# Altium schematic sheet Sheet1.SchDoc
size A3; SheetNumber: 1; SheetTotal: 1
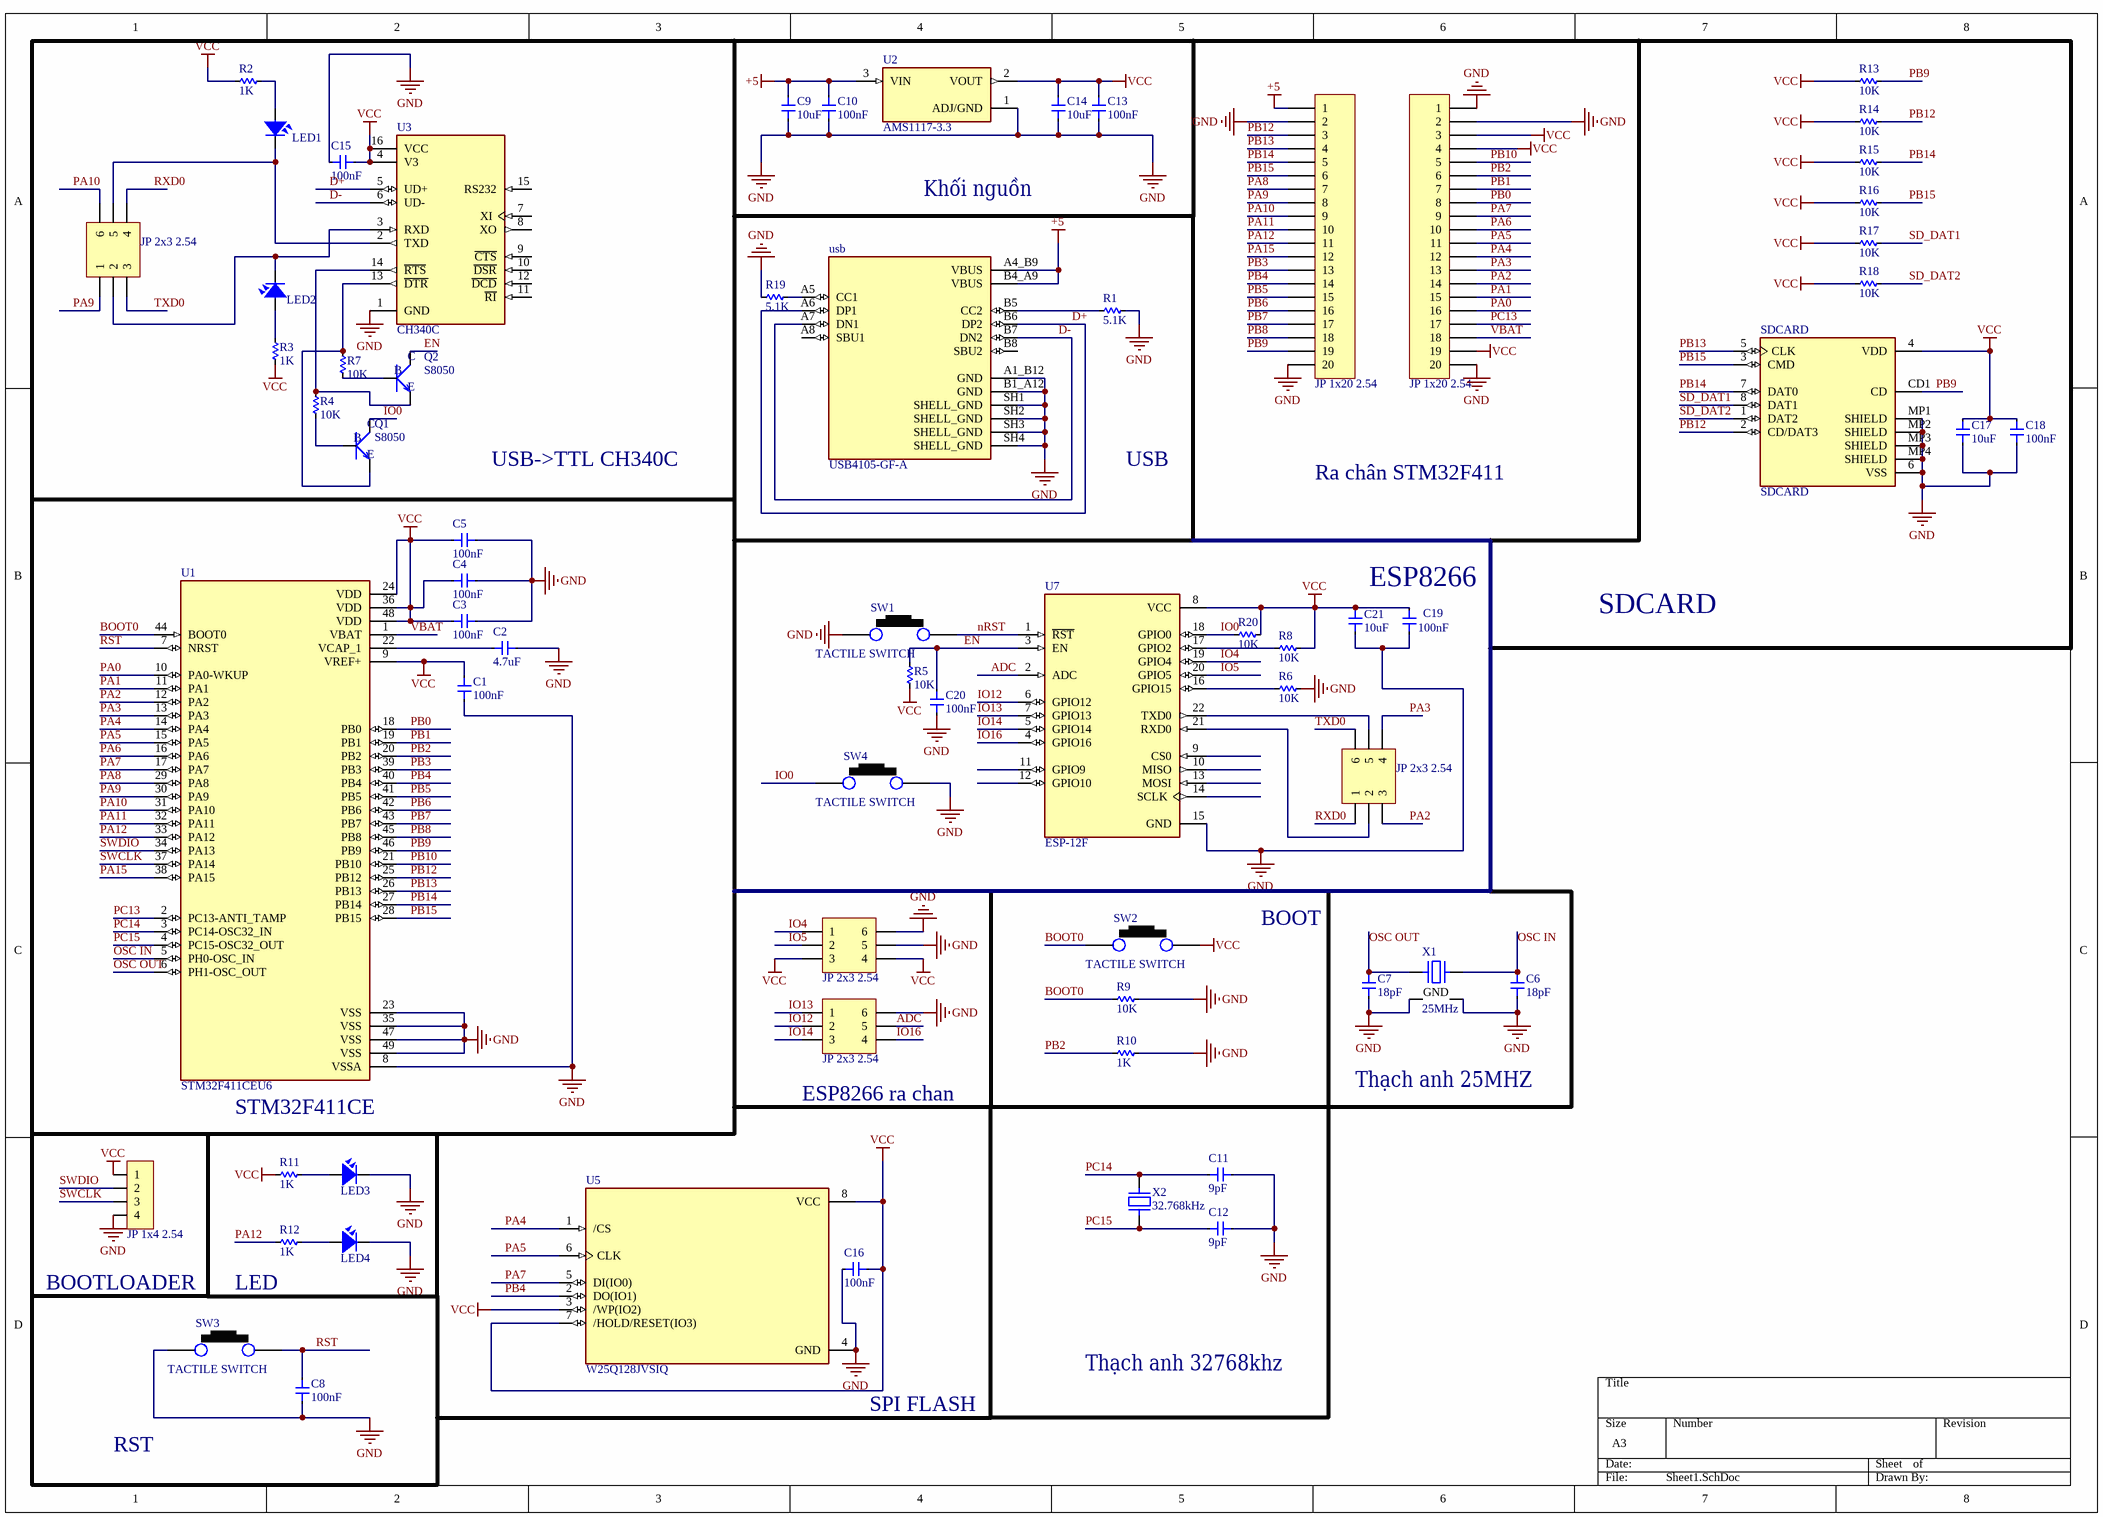
[diagram p0: Sheet1.SchDoc]

## Parts
(Parts that share a designator on the sheet are numbered #1, #2 ... from top to bottom, then left to right.)
?#1  JP 1x20 2.54  [JP 1x20 CT]
?#2  JP 1x20 2.54  [JP 1x20 CT]
?#3  JP 2x3 2.54  [JP 2x3 CT]
?#4  JP 2x3 2.54  [JP 2x3 CT]
?#5  JP 2x3 2.54  [JP 2x3 CT]
?#6  JP 2x3 2.54  [JP 2x3 CT]
C1  100nF  [Cap 0603]
C2  4.7uF  [Cap 0603]
C3  100nF  [Cap 0603]
C4  100nF  [Cap 0603]
C5  100nF  [Cap 0603]
C6  18pF  [Cap 0603]
C7  18pF  [Cap 0603]
C8  100nF  [Cap 0603]
C9  10uF  [Cap 0603]
C10  100nF  [Cap 0603]
C11  9pF  [Cap 0603]
C12  9pF  [Cap 0603]
C13  100nF  [Cap 0603]
C14  10uF  [Cap 0603]
C15  100nF  [Cap 0603]
C16  100nF  [Cap 0603]
C17  10uF  [Cap 0603]
C18  100nF  [Cap 0603]
C19  100nF  [Cap 0603]
C20  100nF  [Cap 0603]
C21  10uF  [Cap 0603]
JP5  JP 1x4 2.54  [JP 1x4 DC]
LED1  LED  [LED-1206-Blue]  (value not drawn)
LED2  LED  [LED-1206-Blue]  (value not drawn)
LED3  LED  [LED-1206-Green]  (value not drawn)
LED4  LED  [LED-1206-Green]  (value not drawn)
Q1  S8050  [SOT-23]
Q2  S8050  [SOT-23]
R1  5.1K  [tro smd 0603]
R2  1K  [tro smd 0603]
R3  1K  [tro smd 0603]
R4  10K  [tro smd 0603]
R5  10K  [tro smd 0603]
R6  10K  [tro smd 0603]
R7  10K  [tro smd 0603]
R8  10K  [tro smd 0603]
R9  10K  [tro smd 0603]
R10  1K  [tro smd 0603]
R11  1K  [tro smd 0603]
R12  1K  [tro smd 0603]
R13  10K  [tro smd 0603]
R14  10K  [tro smd 0603]
R15  10K  [tro smd 0603]
R16  10K  [tro smd 0603]
R17  10K  [tro smd 0603]
R18  10K  [tro smd 0603]
R19  5.1K  [RES 0603]
R20  10K  [tro smd 0603]
SDCARD  SDCARD  [SDCARD]
SW1  TACTILE SWITCH  [SW_342_SMD]
SW2  TACTILE SWITCH  [SW_342_SMD]
SW3  TACTILE SWITCH  [SW_342_SMD]
SW4  TACTILE SWITCH  [SW_342_SMD]
U1  STM32F411CEU6  [QFN50P700X700X60-49N]
U2  AMS1117-3.3  [SOT229P700X180-4N]
U3  CH340C  [SOIC127P600X180-16N]
U5  W25Q128JVSIQ  [SOIC127P790X216-8N]
U7  ESP-12F  [XCVR_ESP-12F]
usb  USB4105-GF-A  [GCT_USB4105-GF-A]
X1  25MHz  [EPSON TSX-3225]
X2  32.768kHz  [ABRACON ABS07]

## Nets
+5: ?#1.1 C9.1 C10.1 U2.3(VIN) usb.A4_B9(VBUS) usb.B4_A9(VBUS)
GND: ?#1.2 ?#1.20 ?#2.1 ?#2.2 ?#2.20 ?#5.5 ?#5.6 ?#6.6 C1.1 C2.1 C3.2 C4.2 C5.2 C6.1 C7.1 C8.1 C9.2 C10.2 C11.1 C12.1 C13.2 C14.2 C15.2 C16.1 C17.1 C18.1 C19.1 C20.2 C21.2 JP5.4 LED3.2 LED4.2 R1.1 R6.1 R9.2 R10.2 R19.2 SDCARD.6(VSS) SDCARD.MP1(SHIELD) SDCARD.MP2(SHIELD) SDCARD.MP3(SHIELD) SDCARD.MP4(SHIELD) SW1.1 SW3.1 SW4.2 U1.8(VSSA) U1.23(VSS) U1.35(VSS) U1.47(VSS) U1.49(VSS) U2.1(ADJ/GND) U3.1(GND) U5.4(GND) U7.15(GND) usb.A1_B12(GND) usb.B1_A12(GND) usb.SH1(SHELL_GND) usb.SH2(SHELL_GND) usb.SH3(SHELL_GND) usb.SH4(SHELL_GND) X1.2(GND) X1.4(GND)
VCC: ?#2.3 ?#2.4 ?#2.19 ?#5.3 ?#5.4 C1.2 C3.1 C4.1 C5.1 C13.1 C14.1 C15.1 C16.2 C17.2 C18.2 C19.2 C21.1 JP5.1 R2.2 R3.2 R5.2 R8.1 R11.1 R13.2 R14.2 R15.2 R16.2 R17.2 R18.2 R20.1 SDCARD.4(VDD) SW2.2 U1.9(VREF+) U1.24(VDD) U1.36(VDD) U1.48(VDD) U2.2(VOUT) U3.4(V3) U3.16(VCC) U5.3(/WP(IO2)) U5.7(/HOLD/RESET(IO3)) U5.8(VCC) U7.8(VCC)
ADC: ?#6.5 U7.2(ADC)
BOOT0: R9.1 SW2.1 U1.44(BOOT0)
D+: U3.5(UD+) usb.A6(DP1) usb.B6(DP2)
D-: U3.6(UD-) usb.A7(DN1) usb.B7(DN2)
EN: C20.1 Q2.3(C) R5.1 U7.3(EN)
IO0: Q1.3(C) R20.2 SW4.1 U7.18(GPIO0)
IO4: ?#5.1 U7.19(GPIO4)
IO5: ?#5.2 U7.20(GPIO5)
IO12: ?#6.2 U7.6(GPIO12)
IO13: ?#6.1 U7.7(GPIO13)
IO14: ?#6.3 U7.5(GPIO14)
IO16: ?#6.4 U7.4(GPIO16)
nRST: SW1.2 U7.1(~{RST})
OSC IN: C6.2 U1.5(PH0-OSC_IN) X1.3
OSC OUT: C7.2 U1.6(PH1-OSC_OUT) X1.1
PA0: ?#2.16 U1.10(PA0-WKUP)
PA1: ?#2.15 U1.11(PA1)
PA2: ?#2.14 ?#4.3 U1.12(PA2)
PA3: ?#2.13 ?#4.4 U1.13(PA3)
PA4: ?#2.12 U1.14(PA4) U5.1(/CS)
PA5: ?#2.11 U1.15(PA5) U5.6(CLK)
PA6: ?#2.10 U1.16(PA6)
PA7: ?#2.9 U1.17(PA7) U5.5(DI(IO0))
PA8: ?#1.7 U1.29(PA8)
PA9: ?#1.8 ?#3.1 U1.30(PA9)
PA10: ?#1.9 ?#3.6 U1.31(PA10)
PA11: ?#1.10 U1.32(PA11)
PA12: ?#1.11 R12.1 U1.33(PA12)
PA15: ?#1.12 U1.38(PA15)
PB0: ?#2.8 U1.18(PB0)
PB1: ?#2.7 U1.19(PB1)
PB2: ?#2.6 R10.1 U1.20(PB2)
PB3: ?#1.13 U1.39(PB3)
PB4: ?#1.14 U1.40(PB4) U5.2(DO(IO1))
PB5: ?#1.15 U1.41(PB5)
PB6: ?#1.16 U1.42(PB6)
PB7: ?#1.17 U1.43(PB7)
PB8: ?#1.18 U1.45(PB8)
PB9: ?#1.19 R13.1 SDCARD.CD1(CD) U1.46(PB9)
PB10: ?#2.5 U1.21(PB10)
PB12: ?#1.3 R14.1 SDCARD.2(CD/DAT3) U1.25(PB12)
PB13: ?#1.4 SDCARD.5(CLK) U1.26(PB13)
PB14: ?#1.5 R15.1 SDCARD.7(DAT0) U1.27(PB14)
PB15: ?#1.6 R16.1 SDCARD.3(CMD) U1.28(PB15)
PC13: ?#2.17 U1.2(PC13-ANTI_TAMP)
PC14: C11.2 U1.3(PC14-OSC32_IN) X2.2
PC15: C12.2 U1.4(PC15-OSC32_OUT) X2.1
RST: C8.2 SW3.2 U1.7(NRST)
RXD0: ?#3.4 ?#4.1
SD_DAT1: R17.1 SDCARD.8(DAT1)
SD_DAT2: R18.1 SDCARD.1(DAT2)
SWCLK: JP5.3 U1.37(PA14)
SWDIO: JP5.2 U1.34(PA13)
TXD0: ?#3.3 ?#4.6
VBAT: ?#2.18 U1.1(VBAT)
Net?#3_2: ?#3.2 LED2.2 U3.3(RXD)
Net?#3_5: ?#3.5 LED1.2 U3.2(TXD)
Net?#4_2: ?#4.2 U7.21(RXD0)
Net?#4_5: ?#4.5 U7.22(TXD0)
NetC2_2: C2.2 U1.22(VCAP_1)
NetLED1_1: LED1.1 R2.1
NetLED2_1: LED2.1 R3.1
NetLED3_1: LED3.1 R11.2
NetLED4_1: LED4.1 R12.2
NetQ1_1: Q1.1(B) R4.2
NetQ1_2: Q1.2(E) R7.1 U3.13(~{DTR})
NetQ2_1: Q2.1(B) R7.2
NetQ2_2: Q2.2(E) R4.1 U3.14(~{RTS})
NetR1_2: R1.2 usb.B5(CC2)
NetR6_2: R6.2 U7.16(GPIO15)
NetR8_2: R8.2 U7.17(GPIO2)
NetR19_1: R19.1 usb.A5(CC1)

Not connected (* = marked no-connect by the designer): U3 7(XI) 8(XO) 9(~{CTS}) 10(~{DSR}) 11(~{RI}) 12(~{DCD}) 15(RS232); U7 9(CS0) 10(MISO) 11(GPIO9) 12(GPIO10) 13(MOSI) 14(SCLK); usb A8(SBU1) B8(SBU2)

## Notes on the sheet
- Khối nguồn
- USB->TTL CH340C
- USB
- Ra chân STM32F411
- ESP8266
- SDCARD
- BOOT
- (near U1) STM32F411CE
- ESP8266 ra chan
- Thạch anh 25MHZ
- BOOTLOADER
- (near R12) LED
- Thạch anh 32768khz
- RST
- SPI FLASH

## Library data of the parts
?#1 ?#2 = JP 1x20 2.54 Cai Thang: Cắm; Ten_Linh_Kien: Jump Đơn Cái 2.54MM 1x20P Thẳng; Don_Vi: Con; Ma_Hang: MH004006; Ghi_Chu: *; Kieu_Chan: *; Chung_Loai: Cắm
?#3-?#6 = JP 2x3 2.54 Cai Thang: Cắm; Ten_Linh_Kien: Jump Đôi Cái 2.54MM 2x20P Thẳng; Don_Vi: Con; Ma_Hang: MH008647; Ghi_Chu: *; Kieu_Chan: *; Chung_Loai: Cắm
C1-C14 C16-C21 = Cap 1206: Capacitor SMD 1206
C15 = Cap 0805: Capacitor SMD 0805
JP5 = JP 1x4 2.54 Duc Cong: Cắm; Ten_Linh_Kien: Jump Đơn Đực 2.54MM 1x40P Cong Đứng; Don_Vi: Con; Ma_Hang: MH000904; Ghi_Chu: *; Kieu_Chan: *; Chung_Loai: Cắm
LED1-LED4 = LED SMD: Value: LED 3 - 5 ly 2 Colour
Q1 Q2 = SMD-TRANSISTORS-NPN-25V-500MW(SOT-23): Bipolar (BJT) Transistor NPN 25 V 500 mA 150MHz 300 mW Surface Mount SOT-23; MF: UMW; Purchase-URL: https://pricing.snapeda.com/search/part/S8050/?ref=eda; Check_prices: https://www.snapeda.com/parts/S8050/Umwelt+Sensor+Teknik/view-part/?ref=eda; SnapEDA_Link: https://www.snapeda.com/parts/S8050/Umwelt+Sensor+Teknik/view-part/?ref=snap; Price: None; Availability: In Stock; Package: None; MP: S8050; Value: *
R1-R20 = Res-SMD: Resistor; Manufacturer: Generic Components; Class: Passive; Published: 08/06/2000; Publisher: Altium Hobart Technology Centre
SW1-SW4 = SW1_RS-282G05A3-SMRT-SMD: Tactile Switch SPST-NO Top Actuated Surface Mount; Manufacturer: ITT C&K; Alternate Part Number-1: NA; Manufacturer Part Number: RS-282G05A3-SMRT; Case/Package: SMD; Supplier-1: SP ROAD; Supplier Part Number-1: RS-282G05A3-SMRT
U1 = STM32F411CEU6: High-performance access line, ARM Cortex-M4 core with DSP and FPU, 512 Kbytes Flash, 100 MHz CPU, ART Accelerator; Package: None; Availability: Unavailable; Value: *; MP: STM32F411CEU6; Price: None
U2 = AMS1117-3.3: Linear Voltage Regulator IC Positive Fixed 1 Output 1A SOT-223-3L; MF: UMW; SnapEDA_Link: https://www.snapeda.com/parts/AMS1117-3.3/UMW/view-part/?ref=snap; Package: SOT-223-3L UMW; Value: *; MP: AMS1117-3.3; Check_prices: https://www.snapeda.com/parts/AMS1117-3.3/UMW/view-part/?ref=eda
U3 = CH340G: USB Interface Integrated Circuit; Value: *; MP: Ch340C
U5 = W25Q128JVSIQ: FLASH - NOR Memory IC 128Mb (16M x 8) SPI - Quad I/O, QPI, DTR 133 MHz 8-SOIC; MF: Winbond Electronics; SnapEDA_Link: https://www.snapeda.com/parts/W25Q128JVSIQ/Winbond/view-part/?ref=snap; Package: SOIC-8 Winbond Electronics; Value: *; MP: W25Q128JVSIQ; Check_prices: https://www.snapeda.com/parts/W25Q128JVSIQ/Winbond/view-part/?ref=eda
U7 = ESP-12F: WiFi Module; MF: AI-Thinker; SnapEDA_Link: https://www.snapeda.com/parts/ESP-12F/AI-Thinker/view-part/?ref=snap; Package: Package; Value: *; MP: ESP-12F; Check_prices: https://www.snapeda.com/parts/ESP-12F/AI-Thinker/view-part/?ref=eda
usb = USB4105-GF-A: MF: {'manufacturer': u'GCT'}; Package: None; Price: None; Value: *; MP: USB4105-GF-A; Availability: Unavailable
X1 = TSX-3225 25.0000MF10P-C3: CRYSTAL 25.00 MHZ 18.0PF SMD; Manufacturer: EPSON; ESR (Equivalent Series Resistance): 40 Ohms; Frequency Stability: ±10ppm; Load Capacitance: 18pF; Operating Mode: Fundamental; Part Number: TSX-3225 25.0000MF10P-C3; ComponentLink1Description: Datasheet; ComponentLink1URL: https://support.epson.biz/td/api/doc_check.php?dl=brief_TSX-3225&lang=en; ComponentLink2Description: DigiKey Link; ComponentLink2URL: http://digikey.com/product-detail/en/epson/TSX-3225-25.0000MF10P-C3/SER4374CT-ND/7932358; Frequency: 25MHz; Frequency Tolerance: ±10ppm; Height - Seated (Max): 0.024" (0.60mm); LastUpdated: 9/2/2020 1:21:54 AM; Lifecycle Status: Active; Minimum Order: 1; Mounting Type: Surface Mount; Operating Temperature: -20°C ~ 85°C; Package / Case: 4-SMD, No Lead; Packaging: TapeAndReel; PartId: 445; Part Status: Active; Price: 0.22; Series: TSX-3225; Size / Dimension: 0.126" L x 0.098" W (3.20mm x 2.50mm); Supplier 1: DigiKey; Supplier Part Number 1: SER4374CT-ND; Type: MHz Crystal; Value: 25MHz
X2 = ABS07-32.768KHZ-9-1-T: CRYSTAL 32.768KHZ 9PF SMD; Manufacturer: Abracon LLC; ESR (Equivalent Series Resistance): 70 kOhms; Frequency Tolerance: ±10ppm; Operating Mode: Fundamental; Part Number: ABS07-32.768KHZ-9-1-T; ComponentLink1Description: Datasheet; ComponentLink1URL: https://abracon.com/Resonators/ABS07.pdf; ComponentLink2Description: DigiKey Link; ComponentLink2URL: http://digikey.com/product-detail/en/abracon-llc/ABS07-32.768KHZ-9-1-T/535-13479-1-ND/5980155; Frequency: 32.768kHz; Height - Seated (Max): 0.035" (0.90mm); LastUpdated: 9/2/2020 1:21:47 AM; Lifecycle Status: Active; Load Capacitance: 9pF; Minimum Order: 0; Mounting Type: Surface Mount; Operating Temperature: -40°C ~ 85°C; Package / Case: 2-SMD, No Lead; Packaging: TapeAndReel; PartId: 380; Part Status: Active; Price: 0.55; Series: ABS07; Size / Dimension: 0.126" L x 0.059" W (3.20mm x 1.50mm); Supplier 1: DigiKey; Supplier Part Number 1: 535-13479-1-ND; Type: kHz Crystal (Tuning Fork); Value: 32.768kHz